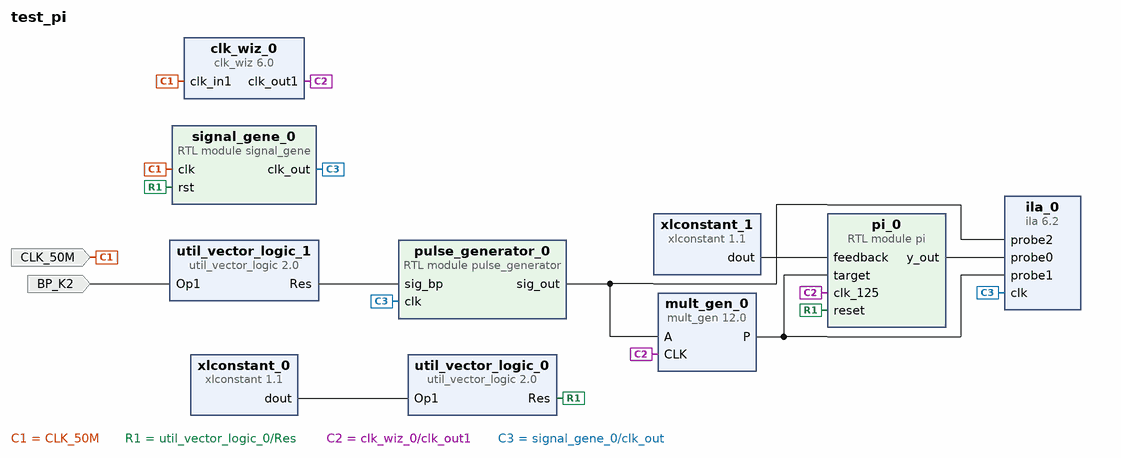
[diagram p0: block diagram of the top level]
# Vivado block design test_pi, xc7z010clg400-1, Vivado 2020.2
create_bd_design test_pi

create_bd_port -dir I -type clk CLK_50M
set_property -dict {CONFIG.FREQ_HZ 50000000} [get_bd_ports CLK_50M]
create_bd_port -dir I BP_K2

create_bd_cell -type ip -vlnv xilinx.com:ip:clk_wiz:6.0 clk_wiz_0
set_property -dict [list \
  CONFIG.CLKIN1_JITTER_PS 200.0 \
  CONFIG.CLKOUT1_DRIVES BUFG \
  CONFIG.CLKOUT1_JITTER 238.699 \
  CONFIG.CLKOUT1_PHASE_ERROR 254.101 \
  CONFIG.CLKOUT1_REQUESTED_OUT_FREQ 125 \
  CONFIG.CLKOUT2_DRIVES BUFG \
  CONFIG.CLKOUT3_DRIVES BUFG \
  CONFIG.CLKOUT4_DRIVES BUFG \
  CONFIG.CLKOUT5_DRIVES BUFG \
  CONFIG.CLKOUT6_DRIVES BUFG \
  CONFIG.CLKOUT7_DRIVES BUFG \
  CONFIG.MMCM_BANDWIDTH OPTIMIZED \
  CONFIG.MMCM_CLKFBOUT_MULT_F 35 \
  CONFIG.MMCM_CLKIN1_PERIOD 20.000 \
  CONFIG.MMCM_CLKIN2_PERIOD 10.0 \
  CONFIG.MMCM_CLKOUT0_DIVIDE_F 7 \
  CONFIG.MMCM_COMPENSATION ZHOLD \
  CONFIG.MMCM_DIVCLK_DIVIDE 2 \
  CONFIG.PLL_CLKIN_PERIOD 20.000 \
  CONFIG.PRIMITIVE PLL \
  CONFIG.PRIM_IN_FREQ 50.00 \
  CONFIG.PRIM_SOURCE Single_ended_clock_capable_pin \
  CONFIG.SECONDARY_SOURCE Single_ended_clock_capable_pin \
  CONFIG.USE_FREQ_SYNTH true \
  CONFIG.USE_LOCKED false \
  CONFIG.USE_PHASE_ALIGNMENT false \
  CONFIG.USE_RESET false \
] [get_bd_cells clk_wiz_0]
create_bd_cell -type ip -vlnv xilinx.com:ip:xlconstant:1.1 xlconstant_0
create_bd_cell -type ip -vlnv xilinx.com:ip:util_vector_logic:2.0 util_vector_logic_0
set_property -dict {CONFIG.C_OPERATION not CONFIG.C_SIZE 1} [get_bd_cells util_vector_logic_0]
create_bd_cell -type ip -vlnv xilinx.com:ip:util_vector_logic:2.0 util_vector_logic_1
set_property -dict {CONFIG.C_OPERATION not CONFIG.C_SIZE 1} [get_bd_cells util_vector_logic_1]
create_bd_cell -type ip -vlnv xilinx.com:ip:mult_gen:12.0 mult_gen_0
set_property -dict [list \
  CONFIG.MultType Constant_Coefficient_Multiplier \
  CONFIG.OutputWidthHigh 15 \
  CONFIG.PortAType Unsigned \
  CONFIG.PortAWidth 1 \
  CONFIG.Use_Custom_Output_Width true \
] [get_bd_cells mult_gen_0]
create_bd_cell -type ip -vlnv xilinx.com:ip:xlconstant:1.1 xlconstant_1
set_property -dict {CONFIG.CONST_VAL 0 CONFIG.CONST_WIDTH 16} [get_bd_cells xlconstant_1]
create_bd_cell -type ip -vlnv xilinx.com:ip:ila:6.2 ila_0
set_property -dict [list \
  CONFIG.ALL_PROBE_SAME_MU_CNT 2 \
  CONFIG.C_ADV_TRIGGER false \
  CONFIG.C_DATA_DEPTH 8192 \
  CONFIG.C_ENABLE_ILA_AXI_MON false \
  CONFIG.C_EN_STRG_QUAL 1 \
  CONFIG.C_MONITOR_TYPE Native \
  CONFIG.C_NUM_OF_PROBES 3 \
  CONFIG.C_PROBE0_MU_CNT 2 \
  CONFIG.C_PROBE0_TYPE 1 \
  CONFIG.C_PROBE0_WIDTH 16 \
  CONFIG.C_PROBE1_MU_CNT 2 \
  CONFIG.C_PROBE1_TYPE 1 \
  CONFIG.C_PROBE1_WIDTH 16 \
  CONFIG.C_PROBE2_MU_CNT 2 \
  CONFIG.C_PROBE2_TYPE 2 \
  CONFIG.C_TRIGIN_EN false \
  CONFIG.C_TRIGOUT_EN false \
] [get_bd_cells ila_0]
create_bd_cell -type module -reference pulse_generator pulse_generator_0
set_property -dict {CONFIG.nb_clk_pulse_high 10} [get_bd_cells pulse_generator_0]
create_bd_cell -type module -reference signal_gene signal_gene_0
set_property -dict {CONFIG.division_horloge 10000 CONFIG.nb_pulse_etat_haut 5000} [get_bd_cells signal_gene_0]
create_bd_cell -type module -reference pi pi_0

# ---- connections ----

connect_bd_net -net clk_in1_0_1 [get_bd_ports CLK_50M] [get_bd_pins clk_wiz_0/clk_in1] [get_bd_pins signal_gene_0/clk]
connect_bd_net [get_bd_pins xlconstant_0/dout] [get_bd_pins util_vector_logic_0/Op1]
connect_bd_net [get_bd_pins util_vector_logic_0/Res] [get_bd_pins signal_gene_0/rst] [get_bd_pins pi_0/reset]
connect_bd_net [get_bd_pins util_vector_logic_1/Res] [get_bd_pins pulse_generator_0/sig_bp]
connect_bd_net -net K2_1 [get_bd_ports BP_K2] [get_bd_pins util_vector_logic_1/Op1]
connect_bd_net [get_bd_pins pulse_generator_0/sig_out] [get_bd_pins mult_gen_0/A] [get_bd_pins ila_0/probe2]
connect_bd_net [get_bd_pins clk_wiz_0/clk_out1] [get_bd_pins mult_gen_0/CLK] [get_bd_pins pi_0/clk_125]
connect_bd_net [get_bd_pins xlconstant_1/dout] [get_bd_pins pi_0/feedback]
connect_bd_net [get_bd_pins mult_gen_0/P] [get_bd_pins ila_0/probe1] [get_bd_pins pi_0/target]
connect_bd_net [get_bd_pins signal_gene_0/clk_out] [get_bd_pins ila_0/clk] [get_bd_pins pulse_generator_0/clk]
connect_bd_net [get_bd_pins pi_0/y_out] [get_bd_pins ila_0/probe0]

validate_bd_design
save_bd_design
